# Altium schematic sheet RK3588-PCIE-SATA.SchDoc
size 420 x 297 mm; SheetNumber: 12; SheetTotal: 22
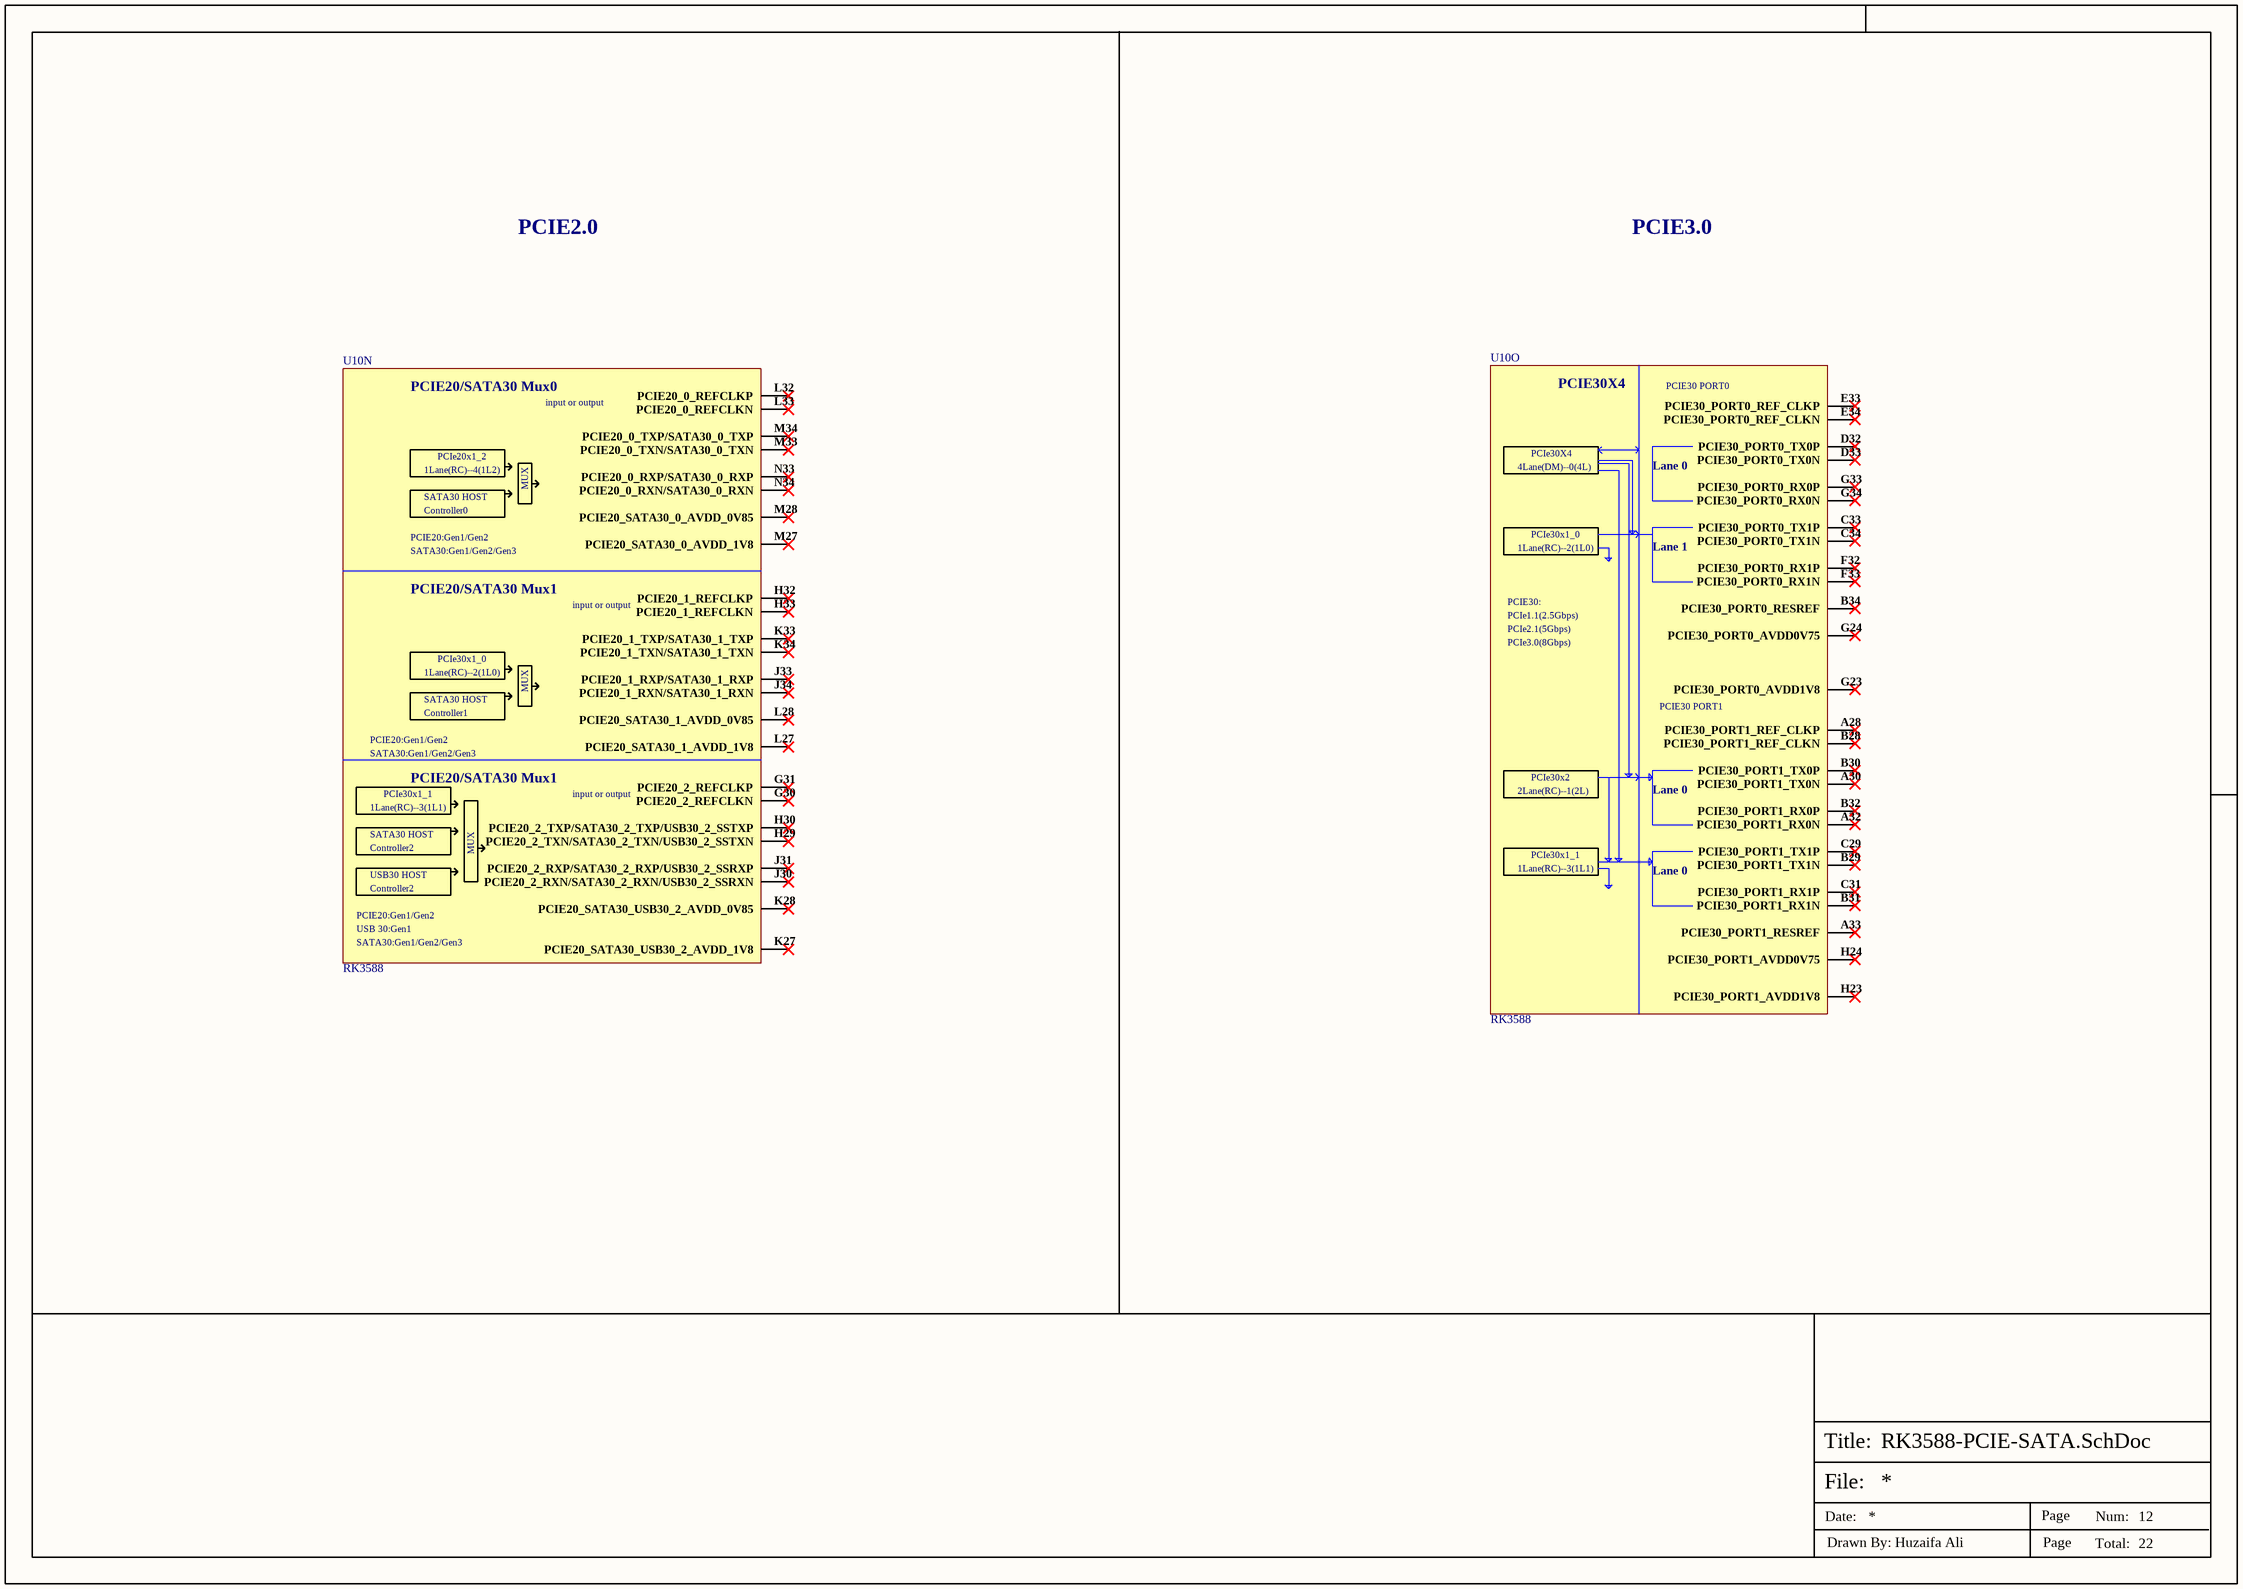
[diagram p0: RK3588-PCIE-SATA.SchDoc]

## Parts
U10  RK3588  [FCBGA-1088L]  (parts N,O of 26)

## Nets

Not connected (* = marked no-connect by the designer): U10 A28(PCIE30_PORT1_REF_CLKP)* A30(PCIE30_PORT1_TX0N)* A32(PCIE30_PORT1_RX0N)* A33(PCIE30_PORT1_RESREF)* B28(PCIE30_PORT1_REF_CLKN)* B29(PCIE30_PORT1_TX1N)* B30(PCIE30_PORT1_TX0P)* B31(PCIE30_PORT1_RX1N)* B32(PCIE30_PORT1_RX0P)* B34(PCIE30_PORT0_RESREF)* C29(PCIE30_PORT1_TX1P)* C31(PCIE30_PORT1_RX1P)* C33(PCIE30_PORT0_TX1P)* C34(PCIE30_PORT0_TX1N)* D32(PCIE30_PORT0_TX0P)* D33(PCIE30_PORT0_TX0N)* E33(PCIE30_PORT0_REF_CLKP)* E34(PCIE30_PORT0_REF_CLKN)* F32(PCIE30_PORT0_RX1P)* F33(PCIE30_PORT0_RX1N)* G23(PCIE30_PORT0_AVDD1V8)* G24(PCIE30_PORT0_AVDD0V75)* G30(PCIE20_2_REFCLKN)* G31(PCIE20_2_REFCLKP)* G33(PCIE30_PORT0_RX0P)* G34(PCIE30_PORT0_RX0N)* H23(PCIE30_PORT1_AVDD1V8)* H24(PCIE30_PORT1_AVDD0V75)* H29(PCIE20_2_TXN/SATA30_2_TXN/USB30_2_SSTXN)* H30(PCIE20_2_TXP/SATA30_2_TXP/USB30_2_SSTXP)* H32(PCIE20_1_REFCLKP)* H33(PCIE20_1_REFCLKN)* J30(PCIE20_2_RXN/SATA30_2_RXN/USB30_2_SSRXN)* J31(PCIE20_2_RXP/SATA30_2_RXP/USB30_2_SSRXP)* J33(PCIE20_1_RXP/SATA30_1_RXP)* J34(PCIE20_1_RXN/SATA30_1_RXN)* K27(PCIE20_SATA30_USB30_2_AVDD_1V8)* K28(PCIE20_SATA30_USB30_2_AVDD_0V85)* K33(PCIE20_1_TXP/SATA30_1_TXP)* K34(PCIE20_1_TXN/SATA30_1_TXN)* L27(PCIE20_SATA30_1_AVDD_1V8)* L28(PCIE20_SATA30_1_AVDD_0V85)* L32(PCIE20_0_REFCLKP)* L33(PCIE20_0_REFCLKN)* M27(PCIE20_SATA30_0_AVDD_1V8)* M28(PCIE20_SATA30_0_AVDD_0V85)* M33(PCIE20_0_TXN/SATA30_0_TXN)* M34(PCIE20_0_TXP/SATA30_0_TXP)* N33(PCIE20_0_RXP/SATA30_0_RXP)* N34(PCIE20_0_RXN/SATA30_0_RXN)*

## Notes on the sheet
- PCIE2.0
- PCIE3.0
- File:
- Title:
- Date:
- Page
- Num:
- Total:
- Drawn By: Huzaifa Ali
- (in symbol RK3588, part N) PCIE20/SATA30 Mux0; input or output; PCIe20x1_2; 1Lane(RC)--4(1L2); MUX; SATA30 HOST; Controller0; PCIE20:Gen1/Gen2; SATA30:Gen1/Gen2/Gen3; PCIE20/SATA30 Mux1; PCIe30x1_0; 1Lane(RC)--2(1L0); Controller1; PCIe30x1_1; 1Lane(RC)--3(1L1); Controller2; USB30 HOST; USB 30:Gen1
- (in symbol RK3588, part O) PCIE30X4; PCIE30 PORT0; PCIe30X4; 4Lane(DM)--0(4L); Lane 0; PCIe30x1_0; 1Lane(RC)--2(1L0); Lane 1; PCIE30:; PCIe1.1(2.5Gbps); PCIe2.1(5Gbps); PCIe3.0(8Gbps); PCIE30 PORT1; PCIe30x2; 2Lane(RC)--1(2L); PCIe30x1_1; 1Lane(RC)--3(1L1)

## Library data of the parts
U10 = RK3588: Power Management IC; Manufacturer Part Number: RK3588LP4XEVB; Manufacturer: Rockchip; LCSC Part Number: *; Item Type: IC